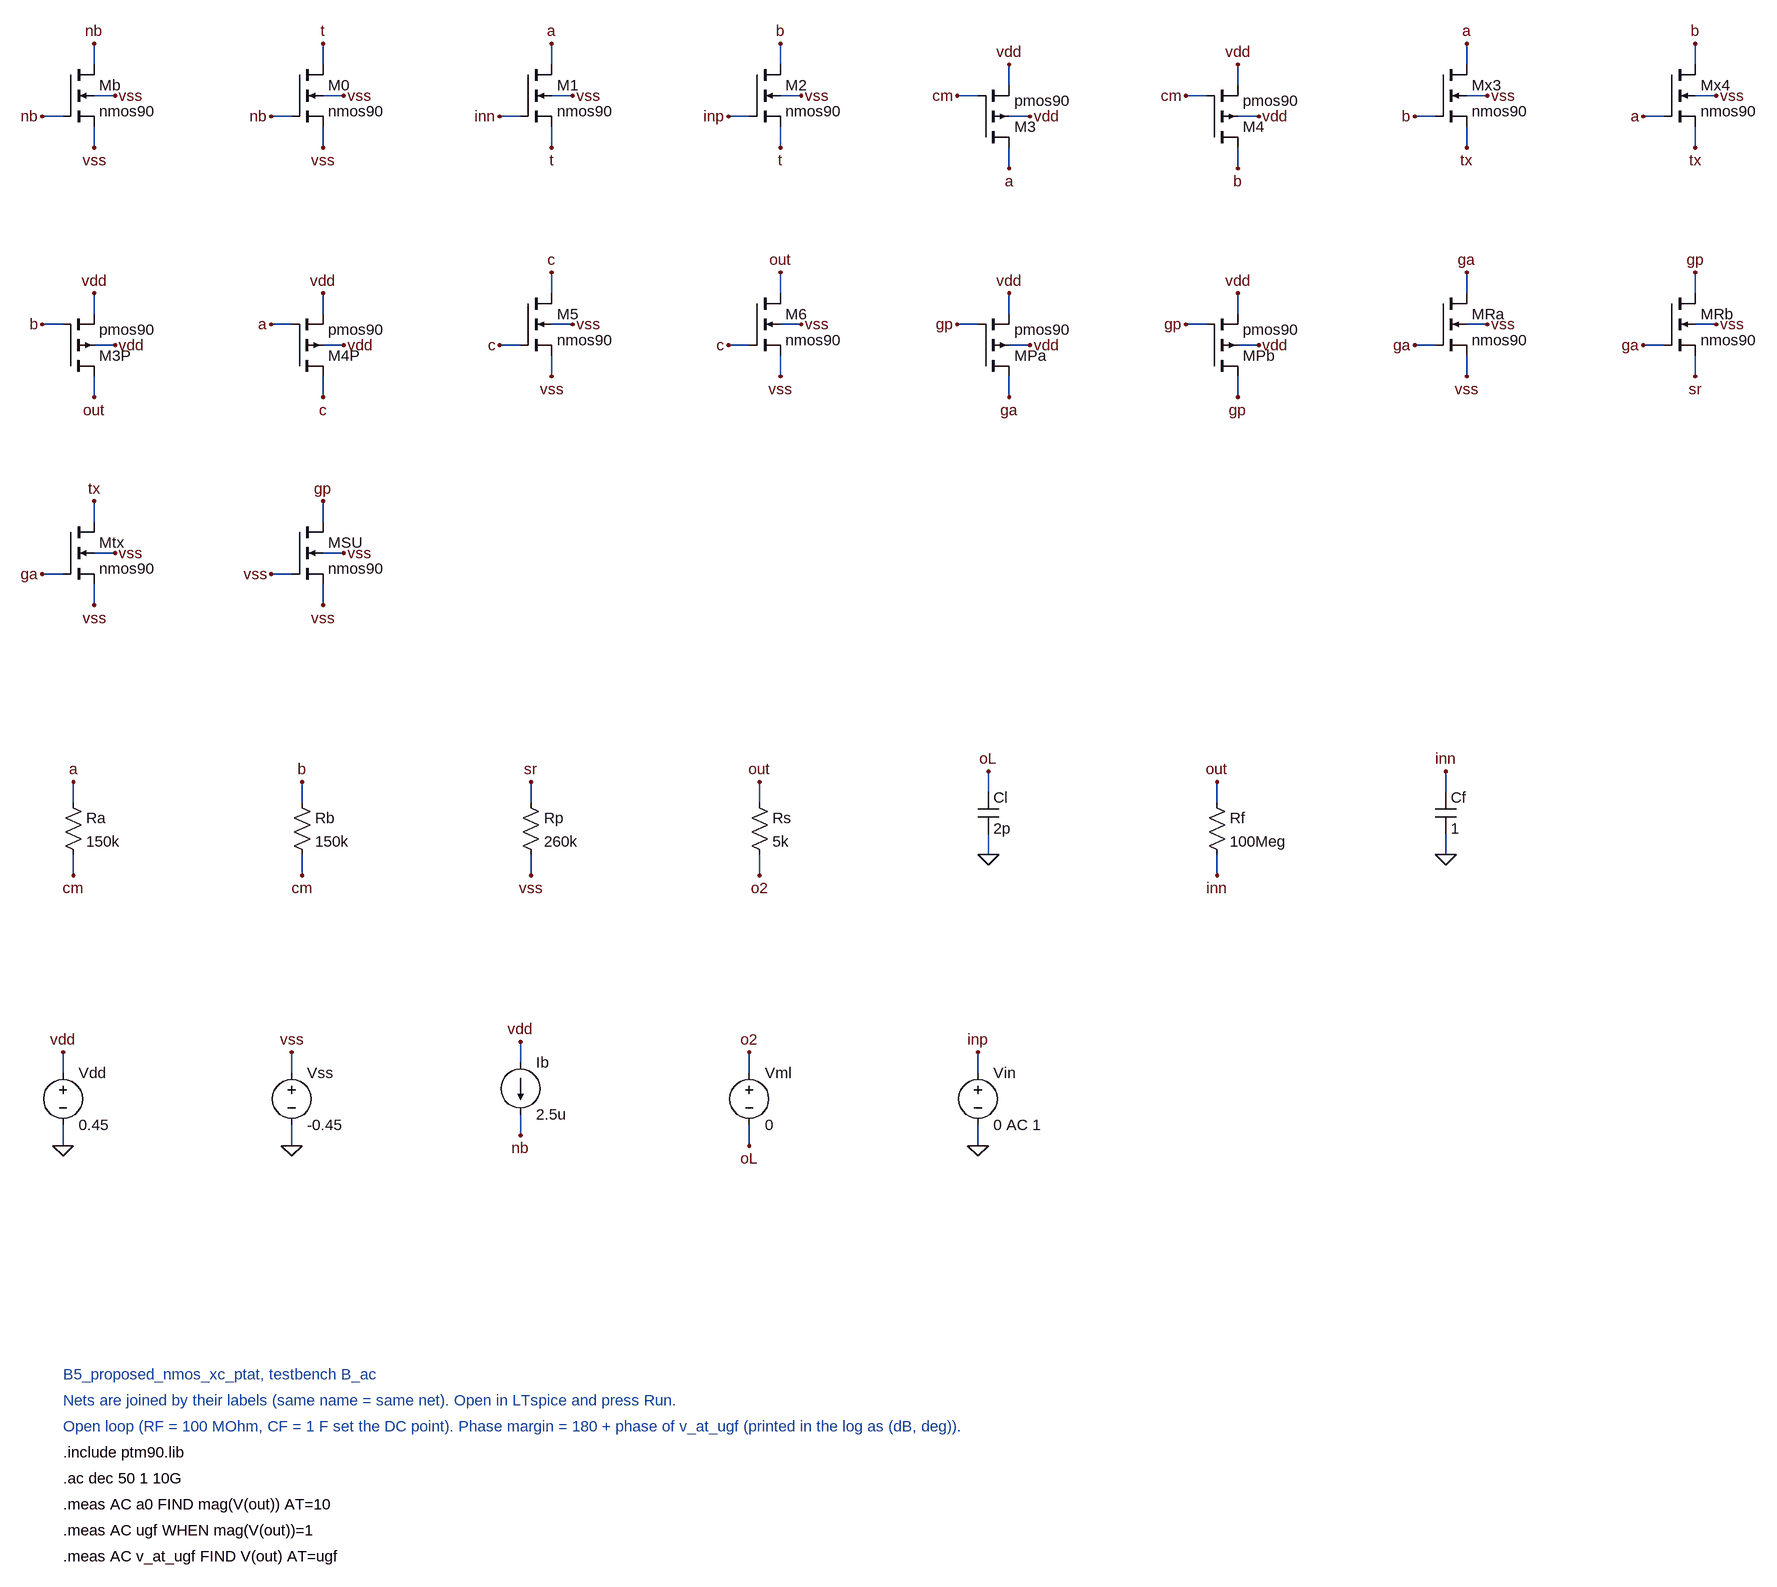
[diagram p0: schematic B5_proposed_nmos_xc_ptat_B_ac.asc]
B5_proposed_nmos_xc_ptat_B_ac.asc, the LTspice schematic file:
Version 4
SHEET 1 3200 2400
WIRE 48 0 48 -32
WIRE 0 80 -32 80
WIRE 48 96 48 128
WIRE 48 48 80 48
WIRE 400 0 400 -32
WIRE 352 80 320 80
WIRE 400 96 400 128
WIRE 400 48 432 48
WIRE 752 0 752 -32
WIRE 704 80 672 80
WIRE 752 96 752 128
WIRE 752 48 784 48
WIRE 1104 0 1104 -32
WIRE 1056 80 1024 80
WIRE 1104 96 1104 128
WIRE 1104 48 1136 48
WIRE 1456 128 1456 160
WIRE 1408 48 1376 48
WIRE 1456 32 1456 0
WIRE 1456 80 1488 80
WIRE 1808 128 1808 160
WIRE 1760 48 1728 48
WIRE 1808 32 1808 0
WIRE 1808 80 1840 80
WIRE 2160 0 2160 -32
WIRE 2112 80 2080 80
WIRE 2160 96 2160 128
WIRE 2160 48 2192 48
WIRE 2512 0 2512 -32
WIRE 2464 80 2432 80
WIRE 2512 96 2512 128
WIRE 2512 48 2544 48
WIRE 48 480 48 512
WIRE 0 400 -32 400
WIRE 48 384 48 352
WIRE 48 432 80 432
WIRE 400 480 400 512
WIRE 352 400 320 400
WIRE 400 384 400 352
WIRE 400 432 432 432
WIRE 752 352 752 320
WIRE 704 432 672 432
WIRE 752 448 752 480
WIRE 752 400 784 400
WIRE 1104 352 1104 320
WIRE 1056 432 1024 432
WIRE 1104 448 1104 480
WIRE 1104 400 1136 400
WIRE 1456 480 1456 512
WIRE 1408 400 1376 400
WIRE 1456 384 1456 352
WIRE 1456 432 1488 432
WIRE 1808 480 1808 512
WIRE 1760 400 1728 400
WIRE 1808 384 1808 352
WIRE 1808 432 1840 432
WIRE 2160 352 2160 320
WIRE 2112 432 2080 432
WIRE 2160 448 2160 480
WIRE 2160 400 2192 400
WIRE 2512 352 2512 320
WIRE 2464 432 2432 432
WIRE 2512 448 2512 480
WIRE 2512 400 2544 400
WIRE 48 704 48 672
WIRE 0 784 -32 784
WIRE 48 800 48 832
WIRE 48 752 80 752
WIRE 400 704 400 672
WIRE 352 784 320 784
WIRE 400 800 400 832
WIRE 400 752 432 752
WIRE 16 1136 16 1104
WIRE 16 1216 16 1248
WIRE 368 1136 368 1104
WIRE 368 1216 368 1248
WIRE 720 1136 720 1104
WIRE 720 1216 720 1248
WIRE 1072 1136 1072 1104
WIRE 1072 1216 1072 1248
WIRE 1424 1120 1424 1088
WIRE 1424 1184 1424 1216
WIRE 1776 1136 1776 1104
WIRE 1776 1216 1776 1248
WIRE 2128 1120 2128 1088
WIRE 2128 1184 2128 1216
WIRE 0 1552 0 1520
WIRE 0 1632 0 1664
WIRE 352 1552 352 1520
WIRE 352 1632 352 1664
WIRE 704 1536 704 1504
WIRE 704 1616 704 1648
WIRE 1056 1552 1056 1520
WIRE 1056 1632 1056 1664
WIRE 1408 1552 1408 1520
WIRE 1408 1632 1408 1664
FLAG 48 -32 nb
FLAG -32 80 nb
FLAG 48 128 vss
FLAG 80 48 vss
FLAG 400 -32 t
FLAG 320 80 nb
FLAG 400 128 vss
FLAG 432 48 vss
FLAG 752 -32 a
FLAG 672 80 inn
FLAG 752 128 t
FLAG 784 48 vss
FLAG 1104 -32 b
FLAG 1024 80 inp
FLAG 1104 128 t
FLAG 1136 48 vss
FLAG 1456 160 a
FLAG 1376 48 cm
FLAG 1456 0 vdd
FLAG 1488 80 vdd
FLAG 1808 160 b
FLAG 1728 48 cm
FLAG 1808 0 vdd
FLAG 1840 80 vdd
FLAG 2160 -32 a
FLAG 2080 80 b
FLAG 2160 128 tx
FLAG 2192 48 vss
FLAG 2512 -32 b
FLAG 2432 80 a
FLAG 2512 128 tx
FLAG 2544 48 vss
FLAG 48 512 out
FLAG -32 400 b
FLAG 48 352 vdd
FLAG 80 432 vdd
FLAG 400 512 c
FLAG 320 400 a
FLAG 400 352 vdd
FLAG 432 432 vdd
FLAG 752 320 c
FLAG 672 432 c
FLAG 752 480 vss
FLAG 784 400 vss
FLAG 1104 320 out
FLAG 1024 432 c
FLAG 1104 480 vss
FLAG 1136 400 vss
FLAG 1456 512 ga
FLAG 1376 400 gp
FLAG 1456 352 vdd
FLAG 1488 432 vdd
FLAG 1808 512 gp
FLAG 1728 400 gp
FLAG 1808 352 vdd
FLAG 1840 432 vdd
FLAG 2160 320 ga
FLAG 2080 432 ga
FLAG 2160 480 vss
FLAG 2192 400 vss
FLAG 2512 320 gp
FLAG 2432 432 ga
FLAG 2512 480 sr
FLAG 2544 400 vss
FLAG 48 672 tx
FLAG -32 784 ga
FLAG 48 832 vss
FLAG 80 752 vss
FLAG 400 672 gp
FLAG 320 784 vss
FLAG 400 832 vss
FLAG 432 752 vss
FLAG 16 1104 a
FLAG 16 1248 cm
FLAG 368 1104 b
FLAG 368 1248 cm
FLAG 720 1104 sr
FLAG 720 1248 vss
FLAG 1072 1104 out
FLAG 1072 1248 o2
FLAG 1424 1088 oL
FLAG 1424 1216 0
FLAG 1776 1104 out
FLAG 1776 1248 inn
FLAG 2128 1088 inn
FLAG 2128 1216 0
FLAG 0 1520 vdd
FLAG 0 1664 0
FLAG 352 1520 vss
FLAG 352 1664 0
FLAG 704 1504 vdd
FLAG 704 1648 nb
FLAG 1056 1520 o2
FLAG 1056 1664 oL
FLAG 1408 1520 inp
FLAG 1408 1664 0
SYMBOL nmos4 0 0 R0
SYMATTR InstName Mb
SYMATTR Value nmos90
SYMATTR Value2 W=10u L=180n
SYMBOL nmos4 352 0 R0
SYMATTR InstName M0
SYMATTR Value nmos90
SYMATTR Value2 W=20u L=180n
SYMBOL nmos4 704 0 R0
SYMATTR InstName M1
SYMATTR Value nmos90
SYMATTR Value2 W=10u L=180n
SYMBOL nmos4 1056 0 R0
SYMATTR InstName M2
SYMATTR Value nmos90
SYMATTR Value2 W=10u L=180n
SYMBOL pmos4 1408 128 M180
SYMATTR InstName M3
SYMATTR Value pmos90
SYMATTR Value2 W=10u L=180n
SYMBOL pmos4 1760 128 M180
SYMATTR InstName M4
SYMATTR Value pmos90
SYMATTR Value2 W=10u L=180n
SYMBOL nmos4 2112 0 R0
SYMATTR InstName Mx3
SYMATTR Value nmos90
SYMATTR Value2 W=2u L=180n
SYMBOL nmos4 2464 0 R0
SYMATTR InstName Mx4
SYMATTR Value nmos90
SYMATTR Value2 W=2u L=180n
SYMBOL pmos4 0 480 M180
SYMATTR InstName M3P
SYMATTR Value pmos90
SYMATTR Value2 W=10u L=180n
SYMBOL pmos4 352 480 M180
SYMATTR InstName M4P
SYMATTR Value pmos90
SYMATTR Value2 W=10u L=180n
SYMBOL nmos4 704 352 R0
SYMATTR InstName M5
SYMATTR Value nmos90
SYMATTR Value2 W=10u L=180n
SYMBOL nmos4 1056 352 R0
SYMATTR InstName M6
SYMATTR Value nmos90
SYMATTR Value2 W=10u L=180n
SYMBOL pmos4 1408 480 M180
SYMATTR InstName MPa
SYMATTR Value pmos90
SYMATTR Value2 W=8u L=4u
SYMBOL pmos4 1760 480 M180
SYMATTR InstName MPb
SYMATTR Value pmos90
SYMATTR Value2 W=8u L=4u
SYMBOL nmos4 2112 352 R0
SYMATTR InstName MRa
SYMATTR Value nmos90
SYMATTR Value2 W=8u L=4u
SYMBOL nmos4 2464 352 R0
SYMATTR InstName MRb
SYMATTR Value nmos90
SYMATTR Value2 W=8u L=4u m=8
SYMBOL nmos4 0 704 R0
SYMATTR InstName Mtx
SYMATTR Value nmos90
SYMATTR Value2 W=8u L=4u m=2
SYMBOL nmos4 352 704 R0
SYMATTR InstName MSU
SYMATTR Value nmos90
SYMATTR Value2 W=0.12u L=4u
SYMBOL res 0 1120 R0
SYMATTR InstName Ra
SYMATTR Value 150k
SYMBOL res 352 1120 R0
SYMATTR InstName Rb
SYMATTR Value 150k
SYMBOL res 704 1120 R0
SYMATTR InstName Rp
SYMATTR Value 260k
SYMBOL res 1056 1120 R0
SYMATTR InstName Rs
SYMATTR Value 5k
SYMBOL cap 1408 1120 R0
SYMATTR InstName Cl
SYMATTR Value 2p
SYMBOL res 1760 1120 R0
SYMATTR InstName Rf
SYMATTR Value 100Meg
SYMBOL cap 2112 1120 R0
SYMATTR InstName Cf
SYMATTR Value 1
SYMBOL voltage 0 1536 R0
SYMATTR InstName Vdd
SYMATTR Value 0.45
SYMBOL voltage 352 1536 R0
SYMATTR InstName Vss
SYMATTR Value -0.45
SYMBOL current 704 1536 R0
SYMATTR InstName Ib
SYMATTR Value 2.5u
SYMBOL voltage 1056 1536 R0
SYMATTR InstName Vml
SYMATTR Value 0
SYMBOL voltage 1408 1536 R0
SYMATTR InstName Vin
SYMATTR Value 0 AC 1
TEXT 0 2016 Left 2 ;B5_proposed_nmos_xc_ptat, testbench B_ac
TEXT 0 2056 Left 2 ;Nets are joined by their labels (same name = same net). Open in LTspice and press Run.
TEXT 0 2096 Left 2 ;Open loop (RF = 100 MOhm, CF = 1 F set the DC point). Phase margin = 180 + phase of v_at_ugf (printed in the log as (dB, deg)).
TEXT 0 2136 Left 2 !.include ptm90.lib
TEXT 0 2176 Left 2 !.ac dec 50 1 10G
TEXT 0 2216 Left 2 !.meas AC a0 FIND mag(V(out)) AT=10
TEXT 0 2256 Left 2 !.meas AC ugf WHEN mag(V(out))=1
TEXT 0 2296 Left 2 !.meas AC v_at_ugf FIND V(out) AT=ugf

The netlist it stands for:
* B5_proposed_nmos_xc_ptat_B_ac.asc
Mb nb nb vss vss nmos90 W=10u L=180n
M0 t nb vss vss nmos90 W=20u L=180n
M1 a inn t vss nmos90 W=10u L=180n
M2 b inp t vss nmos90 W=10u L=180n
M3 a cm vdd vdd pmos90 W=10u L=180n
M4 b cm vdd vdd pmos90 W=10u L=180n
Mx3 a b tx vss nmos90 W=2u L=180n
Mx4 b a tx vss nmos90 W=2u L=180n
M3P out b vdd vdd pmos90 W=10u L=180n
M4P c a vdd vdd pmos90 W=10u L=180n
M5 c c vss vss nmos90 W=10u L=180n
M6 out c vss vss nmos90 W=10u L=180n
MPa ga gp vdd vdd pmos90 W=8u L=4u
MPb gp gp vdd vdd pmos90 W=8u L=4u
MRa ga ga vss vss nmos90 W=8u L=4u
MRb gp ga sr vss nmos90 W=8u L=4u m=8
Mtx tx ga vss vss nmos90 W=8u L=4u m=2
MSU gp vss vss vss nmos90 W=0.12u L=4u
Ra a cm 150k
Rb b cm 150k
Rp sr vss 260k
Rs out o2 5k
Cl oL 0 2p
Rf out inn 100Meg
Cf inn 0 1
Vdd vdd 0 0.45
Vss vss 0 -0.45
Ib vdd nb 2.5u
Vml o2 oL 0
Vin inp 0 0 AC 1
.model NMOS NMOS
.model PMOS PMOS
.lib standard.mos
* B5_proposed_nmos_xc_ptat, testbench B_ac
* Nets are joined by their labels (same name = same net). Open in LTspice and press Run.
* Open loop (RF = 100 MOhm, CF = 1 F set the DC point). Phase margin = 180 + phase of v_at_ugf (printed in the log as (dB, deg)).
.include ptm90.lib
.ac dec 50 1 10G
.meas AC a0 FIND mag(V(out)) AT=10
.meas AC ugf WHEN mag(V(out))=1
.meas AC v_at_ugf FIND V(out) AT=ugf
.backanno
.end